# EasyEDA Pro project REVERB.epro

# Schematic REVERB

## Sheets
1 MAIN: Board Name: Board1; Create Date: 2026-10-26; Page Name: P1; Project Name: REVERB; Schematic Name: Schematic1; Update Date: 2026-10-26; Company: Shota Azuma; Drawn: Shota Azuma; Page Size: A4; Reviewed: Shota Azuma; Version: V1.0.1
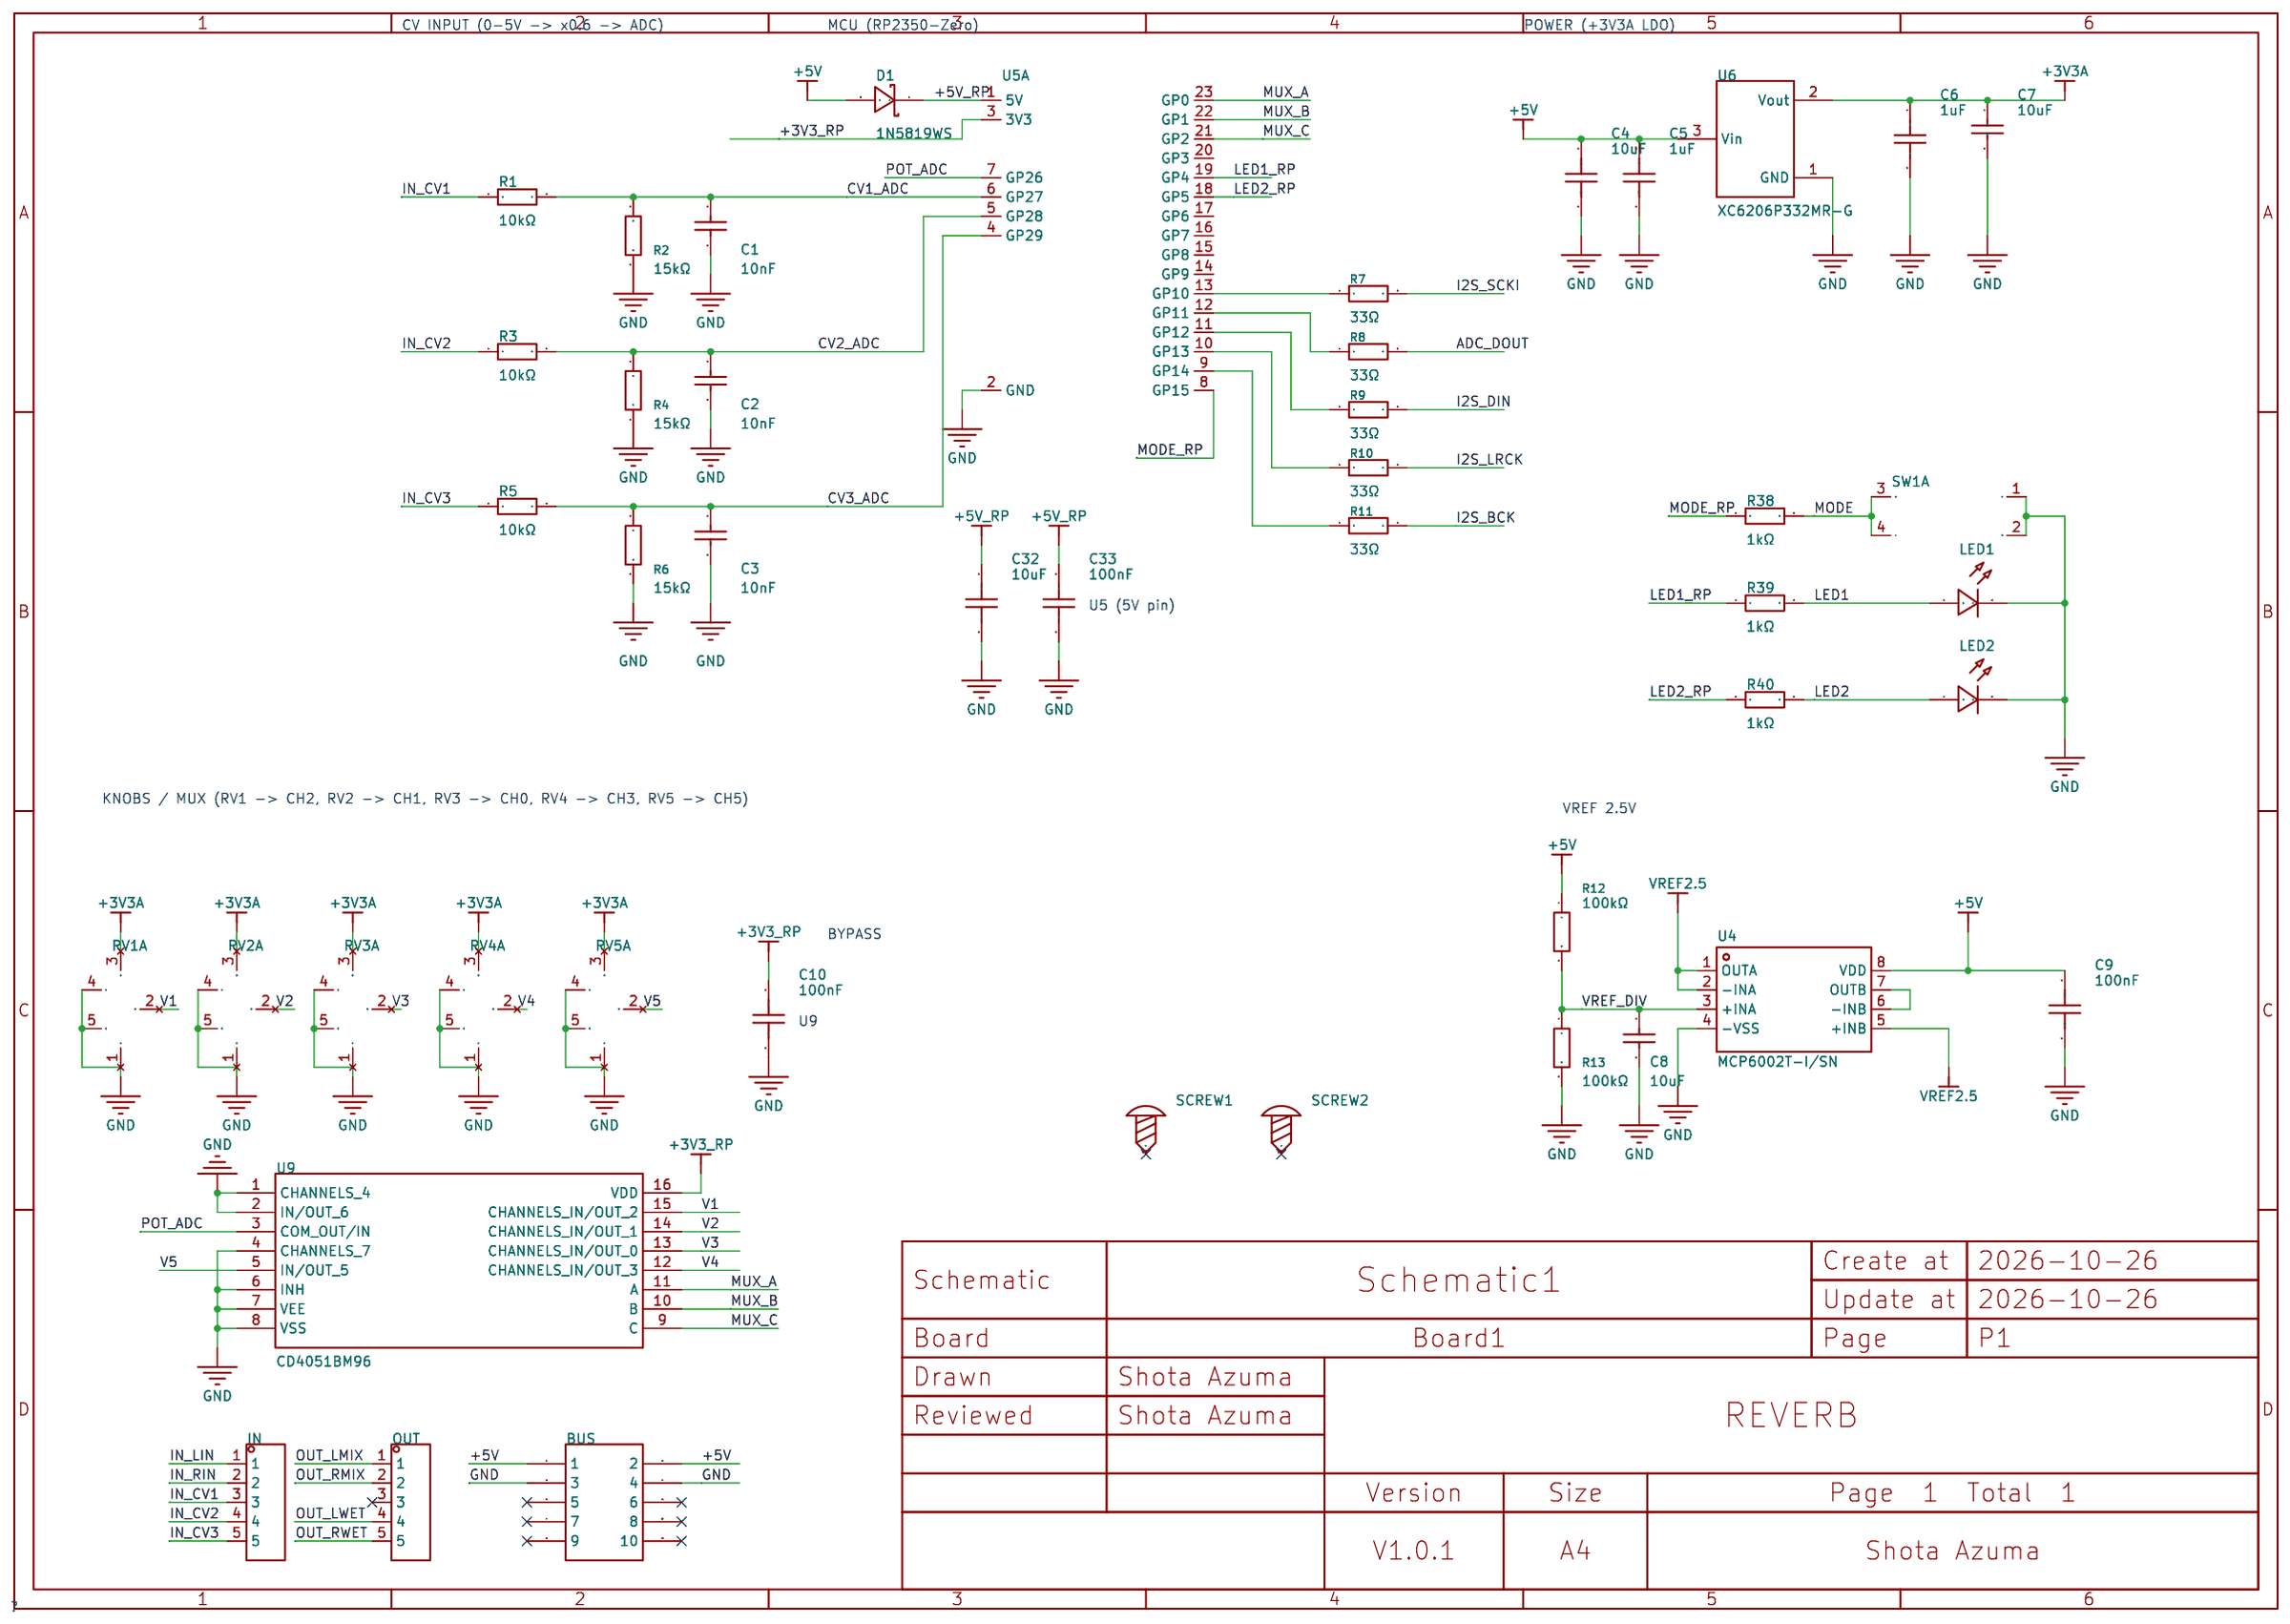
[diagram p0: MAIN]
2 ANALOG_IN_ADC: Page Name: P2
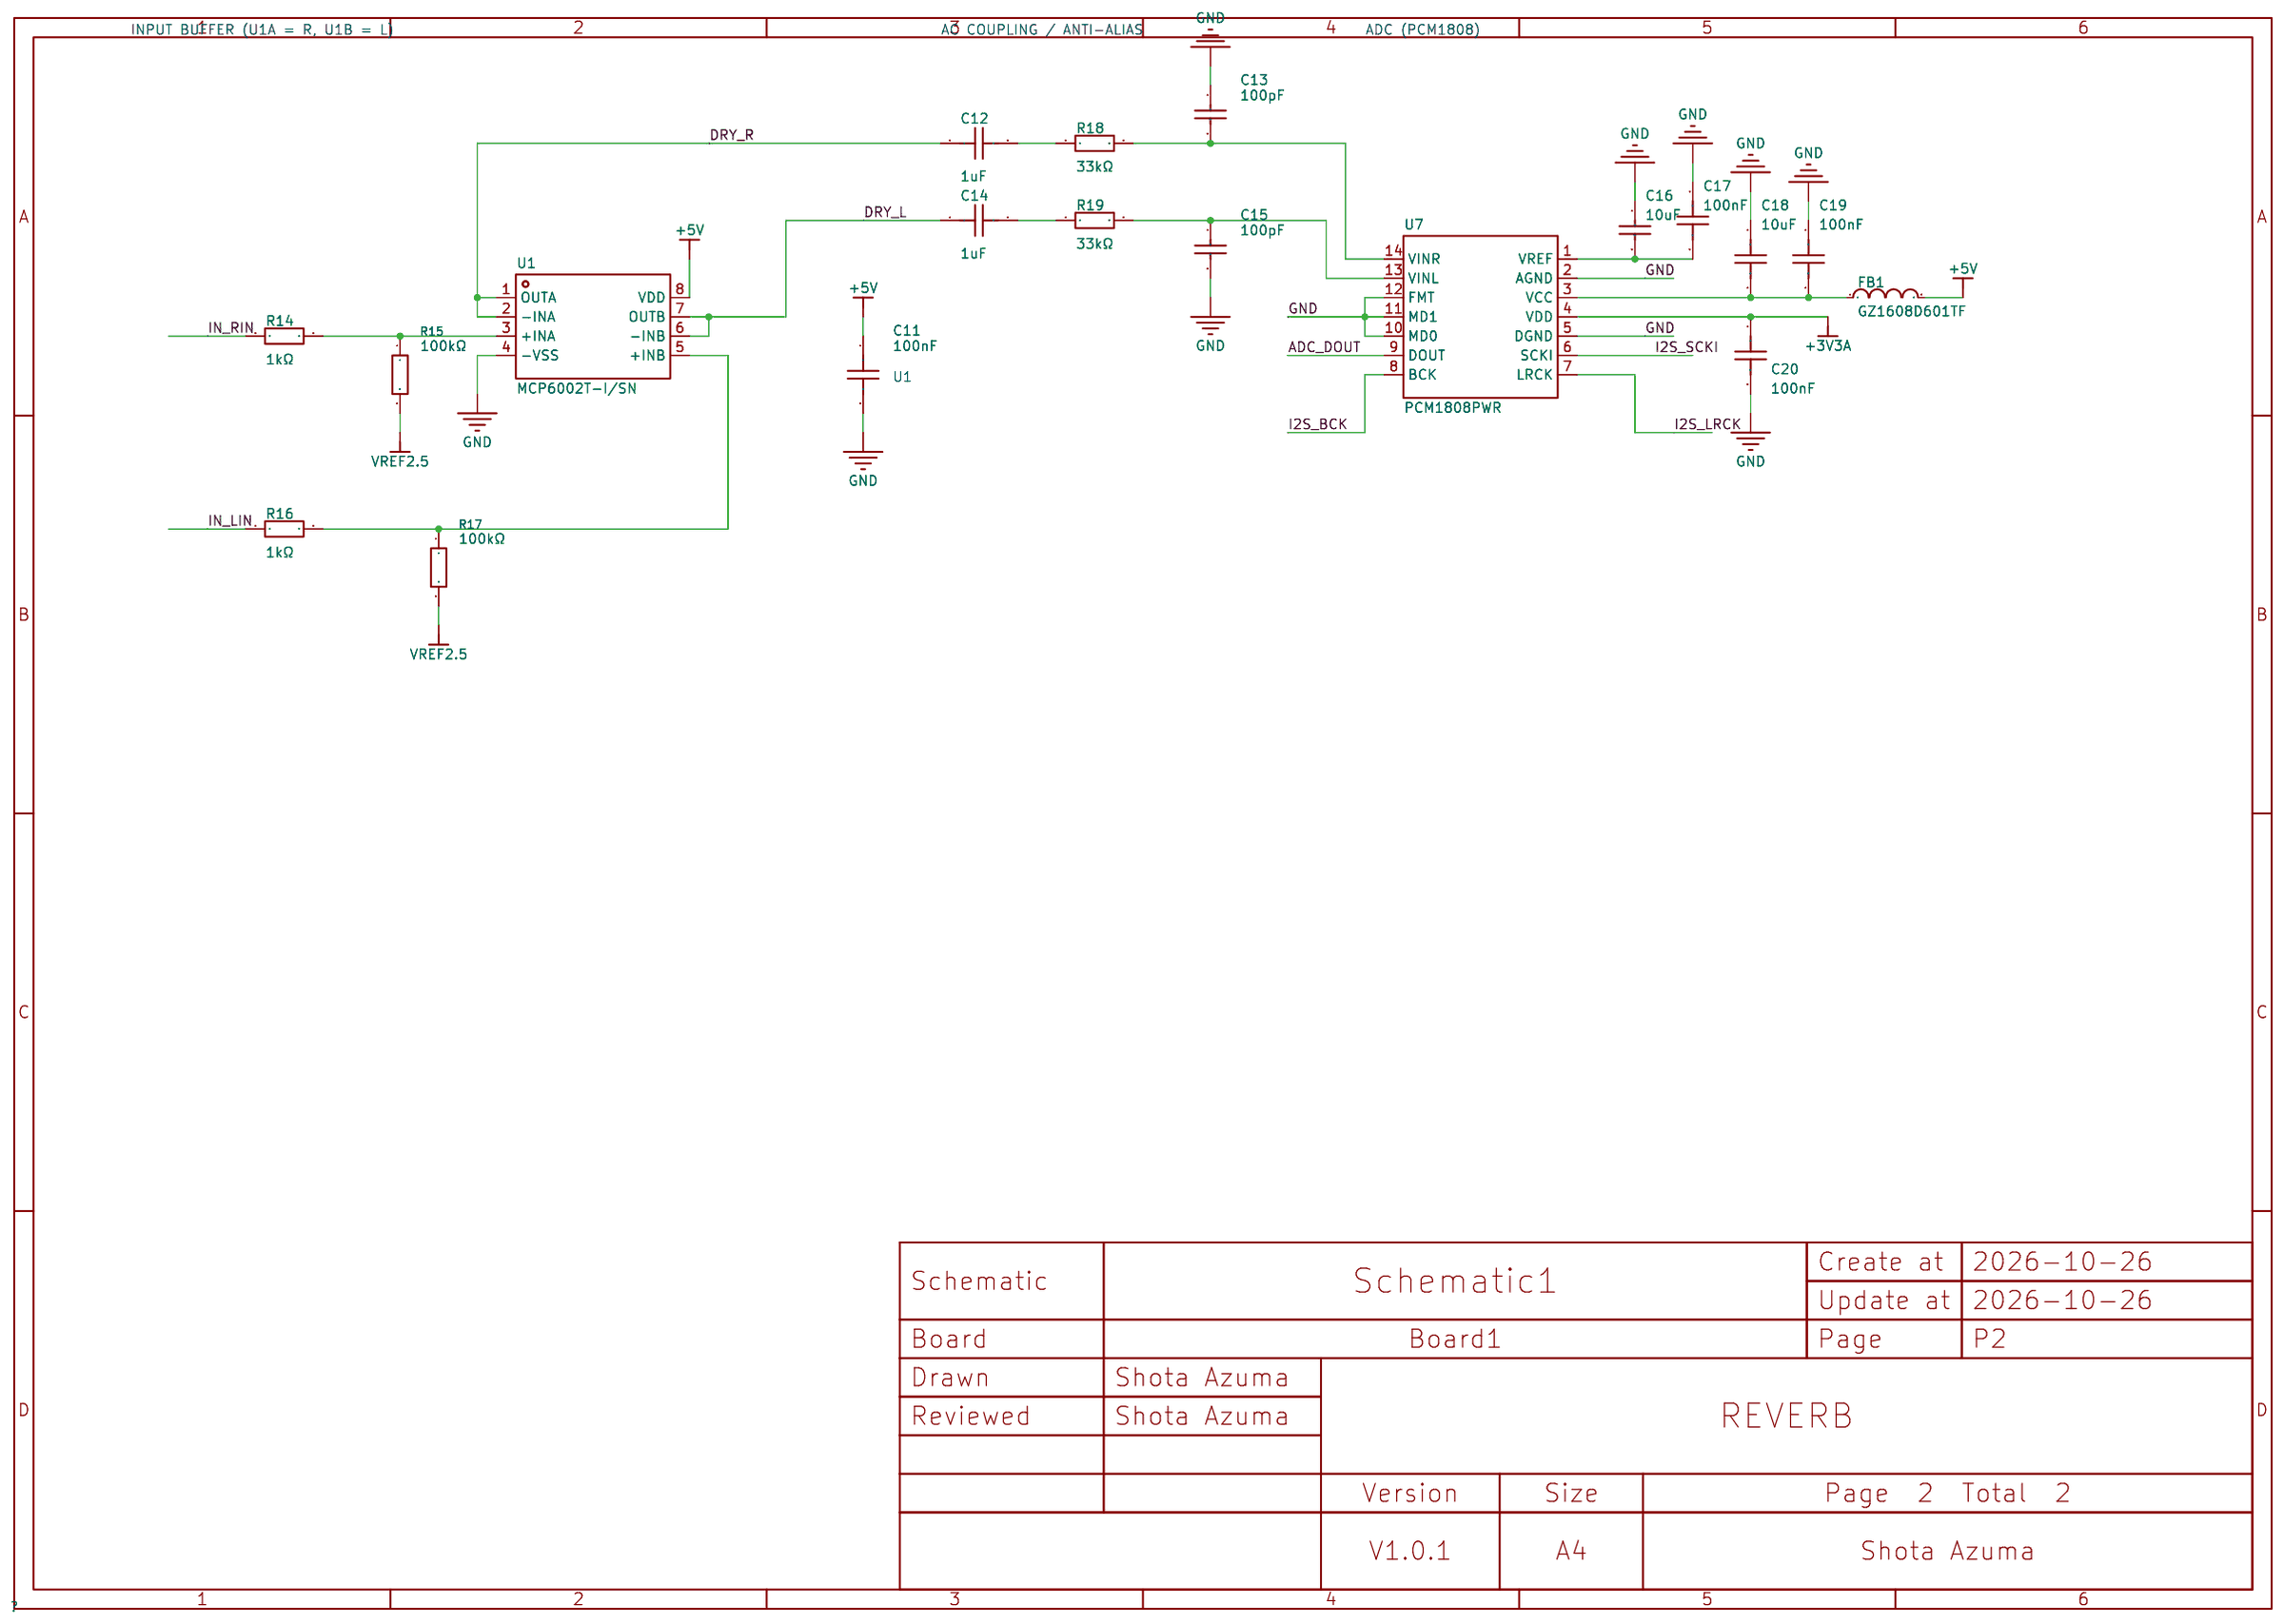
[diagram p1: ANALOG_IN_ADC]
3 DAC_WET_MIX
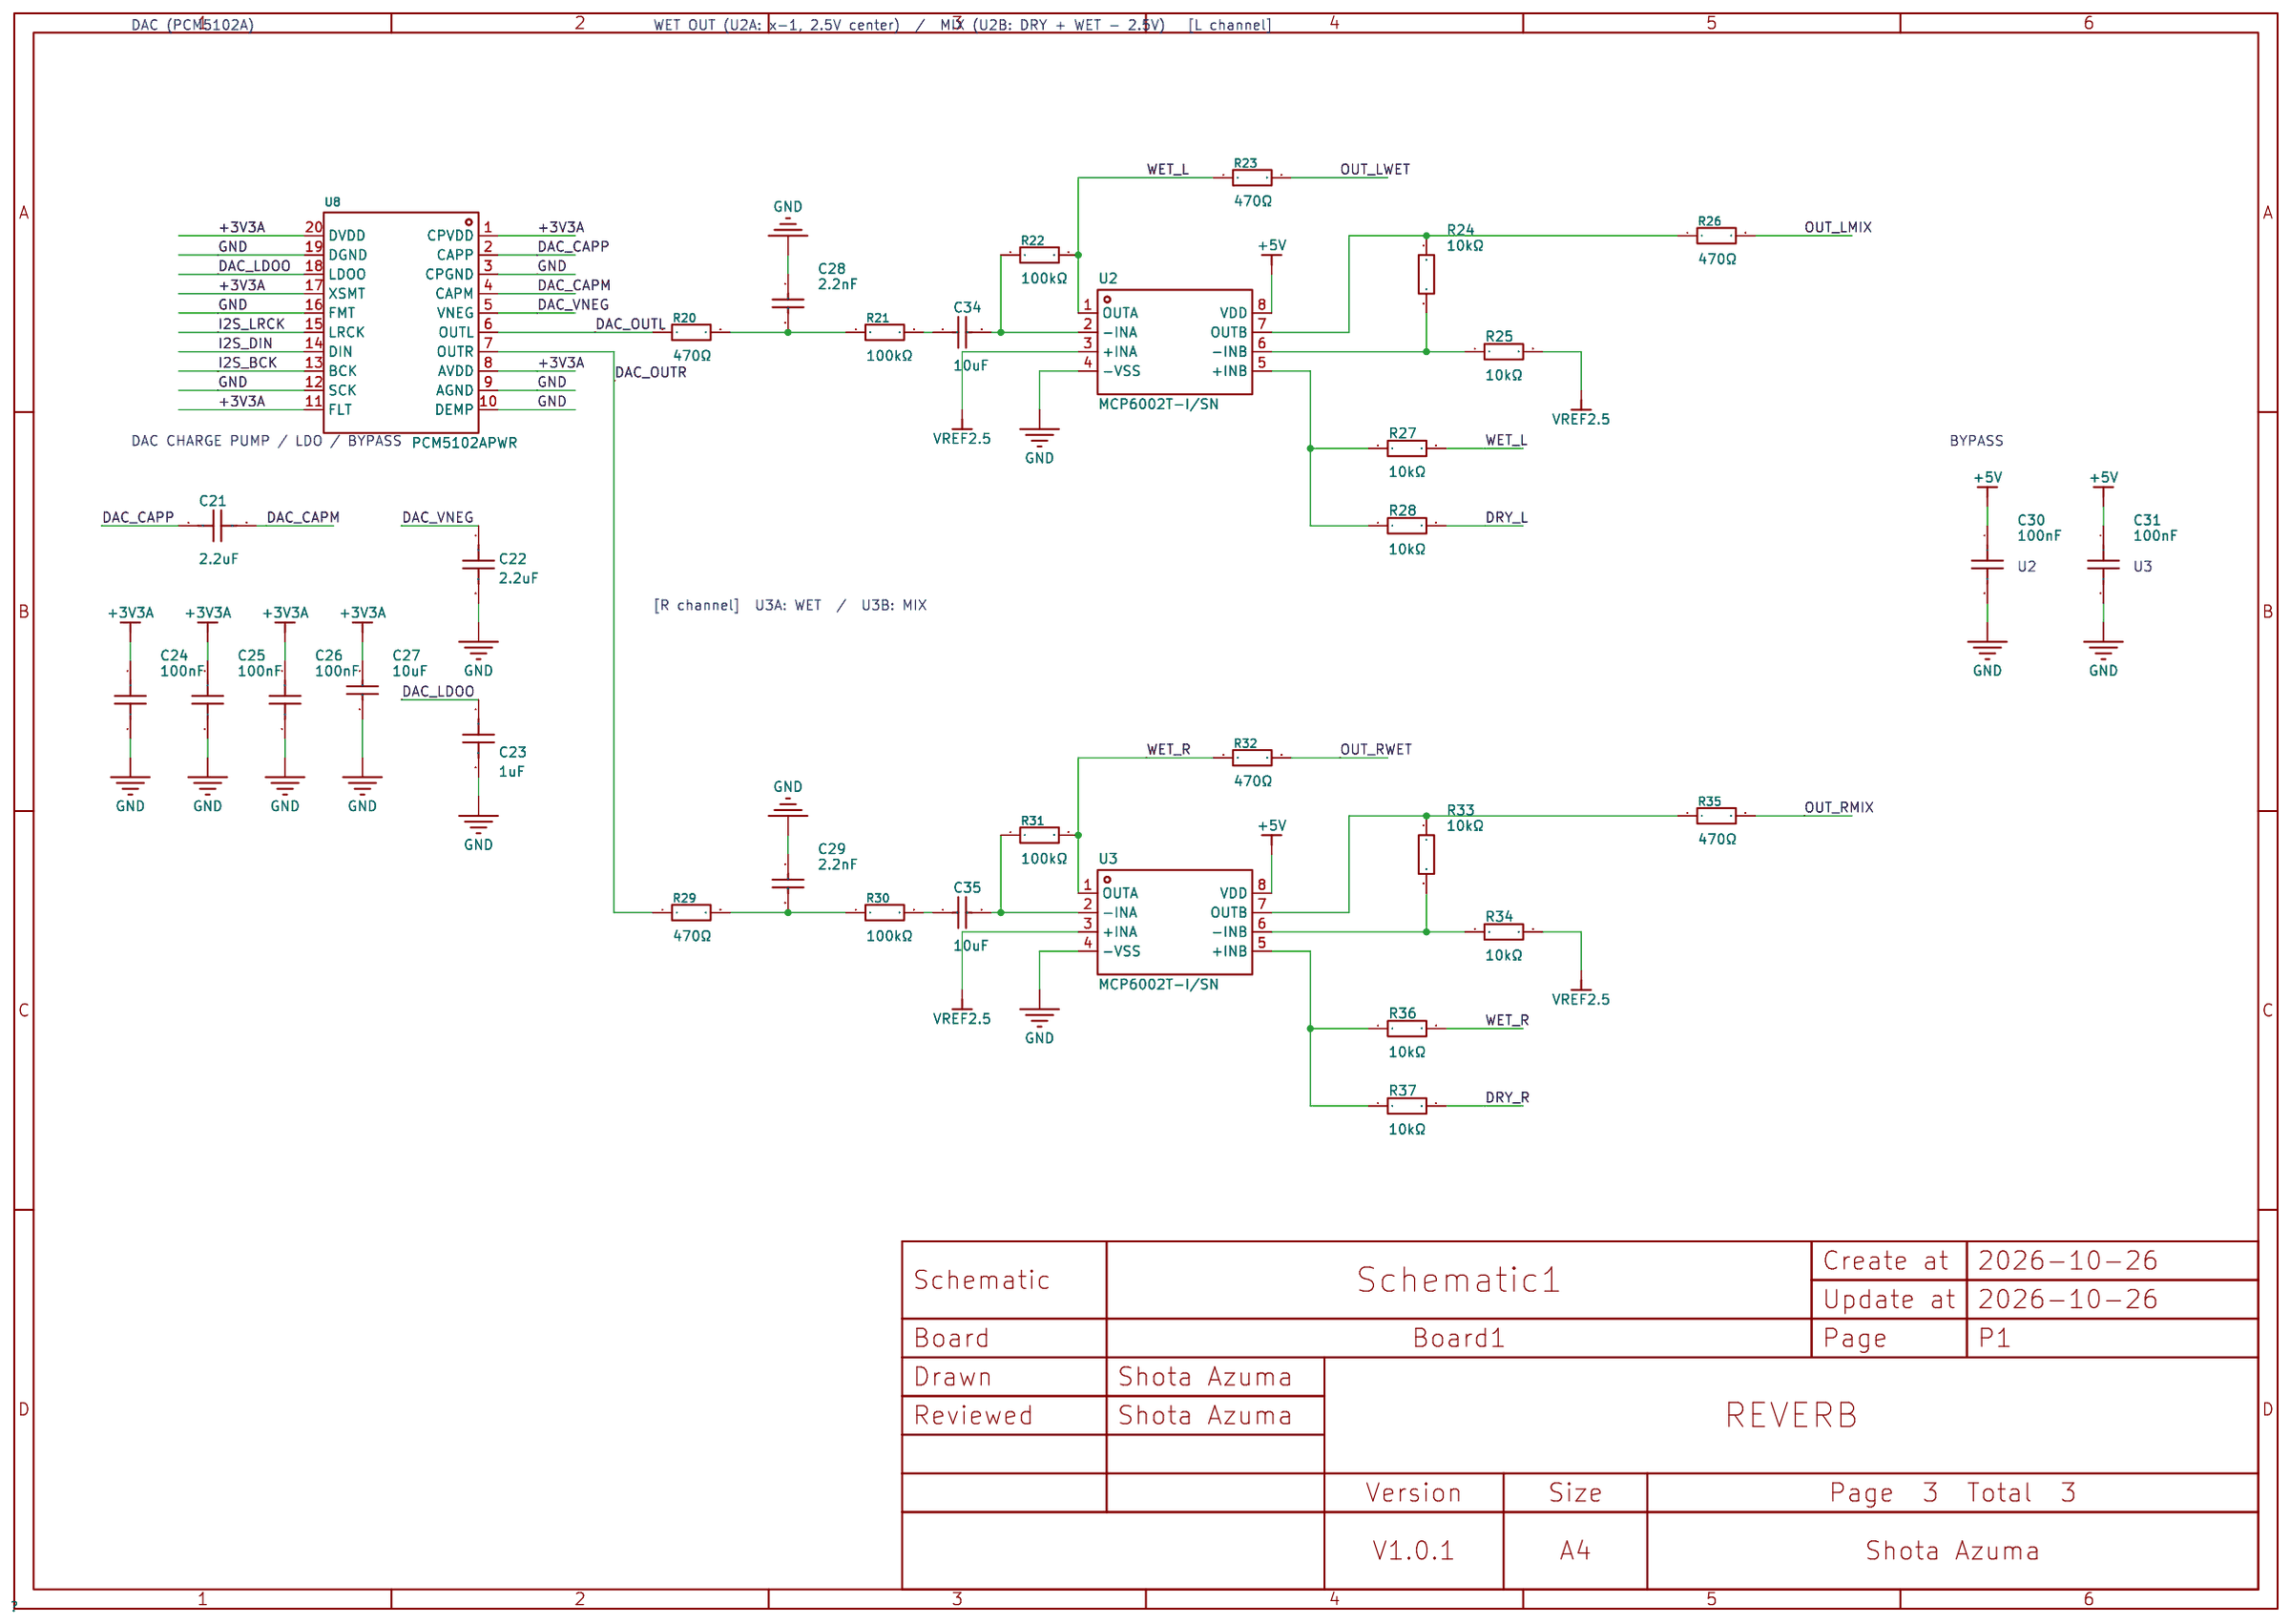
[diagram p2: DAC_WET_MIX]

## Parts
sheet ANALOG_IN_ADC
C11  100nF  [C0402]
C12  1uF  [C0402]
C13  100pF  [C0402]
C14  1uF  [C0402]
C15  100pF  [C0402]
C16  10uF  [C0402]
C17  100nF  [C0402]
C18  10uF  [C0603]
C19  100nF  [C0402]
C20  100nF  [C0402]
FB1  GZ1608D601TF  [L0603]
R14  1kΩ  [R0402]
R15  100kΩ  [R0402]
R16  1kΩ  [R0402]
R17  100kΩ  [R0402]
R18  33kΩ  [R0402]
R19  33kΩ  [R0402]
U1  MCP6002T-I/SN  [SOIC-8_L4.9-W3.9-P1.27-LS6.0-BL]
U7  PCM1808PWR  [TSSOP-14_L5.0-W4.4-P0.65-LS6.4-BL]
sheet DAC_WET_MIX
C21  2.2uF  [C0402]
C22  2.2uF  [C0402]
C23  1uF  [C0402]
C24  100nF  [C0402]
C25  100nF  [C0402]
C26  100nF  [C0402]
C27  10uF  [C0402]
C28  2.2nF  [C0603]
C29  2.2nF  [C0603]
C30  100nF  [C0402]
C31  100nF  [C0402]
C34  10uF  [C0402]
C35  10uF  [C0402]
R20  470Ω  [R0402]
R21  100kΩ  [R0402]
R22  100kΩ  [R0402]
R23  470Ω  [R0402]
R24  10kΩ  [R0402]
R25  10kΩ  [R0402]
R26  470Ω  [R0402]
R27  10kΩ  [R0402]
R28  10kΩ  [R0402]
R29  470Ω  [R0402]
R30  100kΩ  [R0402]
R31  100kΩ  [R0402]
R32  470Ω  [R0402]
R33  10kΩ  [R0402]
R34  10kΩ  [R0402]
R35  470Ω  [R0402]
R36  10kΩ  [R0402]
R37  10kΩ  [R0402]
U2  MCP6002T-I/SN  [SOIC-8_L4.9-W3.9-P1.27-LS6.0-BL]
U3  MCP6002T-I/SN  [SOIC-8_L4.9-W3.9-P1.27-LS6.0-BL]
U8  PCM5102APWR  [TSSOP-20_L6.5-W4.4-P0.65-LS6.4-BL]
sheet MAIN
BUS  -  [HDR-TH_10P-P2.54-V-F-R2-C5-S2.54]  (no BOM)
C1  10nF  [C0402]
C2  10nF  [C0402]
C3  10nF  [C0402]
C4  10uF  [C0603]
C5  1uF  [C0402]
C6  1uF  [C0402]
C7  10uF  [C0402]
C8  10uF  [C0402]
C9  100nF  [C0402]
C10  100nF  [C0402]
C32  10uF  [C0603]
C33  100nF  [C0402]
D1  1N5819WS  [SOD-323_L1.8-W1.3-LS2.5-RD]
IN  -  [HDR-TH_5P-P2.54-V-M]  (no BOM)
LED1  -  [LED-TH_BD3.0-P2.54-FD]  (no BOM)
LED2  -  [LED-TH_BD3.0-P2.54-FD]  (no BOM)
OUT  -  [HDR-TH_5P-P2.54-V-M]  (no BOM)
R1  10kΩ  [R0402]
R2  15kΩ  [R0402]
R3  10kΩ  [R0402]
R4  15kΩ  [R0402]
R5  10kΩ  [R0402]
R6  15kΩ  [R0402]
R7  33Ω  [R0402]
R8  33Ω  [R0402]
R9  33Ω  [R0402]
R10  33Ω  [R0402]
R11  33Ω  [R0402]
R12  100kΩ  [R0402]
R13  100kΩ  [R0402]
R38  1kΩ  [R0402]
R39  1kΩ  [R0402]
R40  1kΩ  [R0402]
RV1  -  [ALPS_RK09K_Vertical]  (section 1)  (no BOM)
RV2  -  [ALPS_RK09K_Vertical]  (section 1)  (no BOM)
RV3  -  [ALPS_RK09K_Vertical]  (section 1)  (no BOM)
RV4  -  [ALPS_RK09K_Vertical]  (section 1)  (no BOM)
RV5  -  [ALPS_RK09K_Vertical]  (section 1)  (no BOM)
SCREW1  -  [Screw-Hole-M3]  (no BOM)
SCREW2  -  [Screw-Hole-M3]  (no BOM)
SW1  -  [TVDP01-G73BB]  (section 1)  (no BOM)
U4  MCP6002T-I/SN  [SOIC-8_L4.9-W3.9-P1.27-LS6.0-BL]
U5  -  [RP2350-Zero]  (section 1)  (no BOM)
U6  XC6206P332MR-G  [SOT-23-3_L2.9-W1.6-P1.90-LS2.8-BR]
U9  CD4051BM96  [SOIC-16_L9.9-W3.9-P1.27-LS6.0-BL]

## Library data of the parts
C9-C11 C17 C19 C20 C24-C26 C30 C31 C33 = CL05B104KO5NNNC: Capacitance:100nF Tolerance:±10% Tolerance:±10% Voltage Rating:16V Temperature Coefficient:X7R; LCSC Part Name: 100nF ±10% 16V; Supplier Part: C1525; Manufacturer: SAMSUNG(三星); Supplier Footprint: 0402; JLCPCB Part Class: Basic Part; Datasheet: https://item.szlcsc.com/datasheet/CL05B104KO5NNNC/1877.html; Supplier: LCSC; Tolerance: ±10%; Voltage Rating: 16V; Temperature Coefficient: X7R
C5 C6 C12 C14 C23 = CL05A105KA5NQNC: Capacitance:1uF Tolerance:±10% Tolerance:±10% Voltage Rating:25V Temperature Coefficient:X5R; LCSC Part Name: 1uF ±10% 25V; Supplier Part: C52923; Manufacturer: SAMSUNG(三星); Supplier Footprint: 0402; JLCPCB Part Class: Basic Part; Datasheet: https://item.szlcsc.com/datasheet/CL05A105KA5NQNC/53938.html; Supplier: LCSC; Tolerance: ±10%; Voltage Rating: 25V; Temperature Coefficient: X5R
C13 C15 = 0402CG101J500NT: Capacitance:100pF Tolerance:±5% Tolerance:±5% Voltage Rating:50V Temperature Coefficient:C0G; LCSC Part Name: 100pF ±5% 50V; Supplier Part: C1546; Manufacturer: FH(风华); Supplier Footprint: 0402; JLCPCB Part Class: Basic Part; Datasheet: https://item.szlcsc.com/datasheet/0402CG101J500NT/1898.html; Supplier: LCSC; Tolerance: ±5%; Voltage Rating: 50V; Temperature Coefficient: C0G
C7 C8 C16 C27 C34 C35 = CL05A106MQ5NUNC: Capacitance:10uF Tolerance:±20% Tolerance:±20% Voltage Rating:6.3V Temperature Coefficient:X5R; LCSC Part Name: 10uF ±20% 6.3V; Supplier Part: C15525; Manufacturer: SAMSUNG(三星); Supplier Footprint: 0402; JLCPCB Part Class: Basic Part; Datasheet: https://item.szlcsc.com/datasheet/CL05A106MQ5NUNC/16204.html; Supplier: LCSC; Tolerance: ±20%; Voltage Rating: 6.3V; Temperature Coefficient: X5R
C4 C18 C32 = CL10A106KP8NNNC: Capacitance:10uF Tolerance:±10% Tolerance:±10% Voltage Rating:10V Temperature Coefficient:X5R; LCSC Part Name: 10uF ±10% 10V; Supplier Part: C19702; Manufacturer: SAMSUNG(三星); Supplier Footprint: 0603; JLCPCB Part Class: Basic Part; Datasheet: https://item.szlcsc.com/datasheet/CL10A106KP8NNNC/20411.html; Supplier: LCSC; Tolerance: ±10%; Voltage Rating: 10V; Temperature Coefficient: X5R
FB1 = GZ1608D601TF: Impedance @ Frequency:600Ω@100MHz Tolerance:±25% Tolerance:±25% DC Resistance(DCR):450mΩ Current Rating:200mA Number of Circuits:1 Operating Temperature:-55℃~+125℃ Operating Temperature:-55℃~+125℃; LCSC Part Name: 单路 0603磁珠 阻抗600Ω@100MHz; Supplier Part: C1002; Manufacturer: Sunlord(顺络); Supplier Footprint: 0603; JLCPCB Part Class: Basic Part; Datasheet: https://item.szlcsc.com/datasheet/GZ1608D601TF/1354.html; Supplier: LCSC; Impedance @ Frequency: 600Ω@100MHz; Tolerance: ±25%; DC Resistance(DCR): 450mΩ; Current Rating: 200mA; Number of Circuits: 1; Operating Temperature: -55℃~+125℃
R14 R16 R38-R40 = 0402WGF1001TCE: Type:Thick Film Resistor Resistance:1kΩ Tolerance:±1% Tolerance:±1% Power(Watts):62.5mW Voltage-Supply(Max):50V Temperature Coefficient:±100ppm/℃ Temperature Coefficient:±100ppm/℃ Operating Temperature:-55℃~+155℃ Operating Temperature:-55℃~+155℃; LCSC Part Name: 厚膜电阻 1kΩ ±1%; Supplier Part: C11702; Manufacturer: UNI-ROYAL(厚声); Supplier Footprint: 0402; JLCPCB Part Class: Basic Part; Datasheet: https://item.szlcsc.com/datasheet/0402WGF1001TCE/12256.html; Supplier: LCSC; Type: Thick Film Resistor; Tolerance: ±1%; Power(Watts): 62.5mW; Voltage-Supply(Max): 50V; Temperature Coefficient: ±100ppm/℃; Operating Temperature: -55℃~+155℃
R12 R13 R15 R17 R21 R22 R30 R31 = 0402WGF1003TCE: Type:Thick Film Resistor Resistance:100kΩ Tolerance:±1% Tolerance:±1% Power(Watts):62.5mW Voltage-Supply(Max):50V Temperature Coefficient:±100ppm/℃ Temperature Coefficient:±100ppm/℃ Operating Temperature:-55℃~+155℃ Operating Temperature:-55℃~+155℃; LCSC Part Name: 厚膜电阻 100kΩ ±1%; Supplier Part: C25741; Manufacturer: UNI-ROYAL(厚声); Supplier Footprint: 0402; JLCPCB Part Class: Basic Part; Datasheet: https://item.szlcsc.com/datasheet/0402WGF1003TCE/26484.html; Supplier: LCSC; Type: Thick Film Resistor; Tolerance: ±1%; Power(Watts): 62.5mW; Voltage-Supply(Max): 50V; Temperature Coefficient: ±100ppm/℃; Operating Temperature: -55℃~+155℃
R18 R19 = 0402WGF3302TCE: Type:Thick Film Resistors Resistance:33kΩ Tolerance:±1% Tolerance:±1% Power(Watts): Overload Voltage (Max): Temperature Coefficient:±100ppm/℃ Temperature Coefficient:±100ppm/℃ Operating Temperature Range:-55℃~+155℃ Operating Temperature Range:-55℃~+155℃; LCSC Part Name: 33kΩ ±1% 62.5mW 厚膜电阻; Supplier Part: C25779; Manufacturer: UNI-ROYAL(厚声); Supplier Footprint: 0402; JLCPCB Part Class: Basic Part; Datasheet: https://atta.szlcsc.com/upload/public/pdf/source/20200306/C422600_1E6D84923E4A46A82E41ADD87F860B5C.pdf; Supplier: LCSC; Type: Thick Film Resistors; Tolerance: ±1%; Temperature Coefficient: ±100ppm/℃; Operating Temperature Range: -55℃~+155℃
U1-U4 = MCP6002T-I/SN: Number of Channels:2 Rail to Rail:Rail-to-Rail Input, Rail-to-Rail Output Gain Bandwidth Product:1MHz Vos - Input Offset Voltage:4.5mV Input Offset Voltage Drift(Vos TC):2uV/℃ Slew Rate:600V/ms Ib - Input Bias Current:1pA Input Offset Current(Ios):1pA Inp; LCSC Part Name: 1 MHz 低功耗运算放大器; Supplier Part: C7377; Manufacturer: MICROCHIP(美国微芯); Supplier Footprint: SOIC-8; JLCPCB Part Class: Extended Part; Datasheet: https://item.szlcsc.com/datasheet/MCP6002T-I%252FSN/7854.html; Supplier: LCSC; Number of Channels: 2; Rail to Rail: Rail-to-Rail Input, Rail-to-Rail Output; Gain Bandwidth Product: 1MHz; Vos - Input Offset Voltage: 4.5mV; Input Offset Voltage Drift(Vos TC): 2uV/℃; Slew Rate: 600V/ms; Ib - Input Bias Current: 1pA; Input Offset Current(Ios): 1pA; Input Voltage Noise Density: 28nV/√Hz@1kHz; Common Mode Rejection Ratio(CMRR): 76dB; Quiescent Current: 100uA; Output Current: 23mA; Operating Temperature: -40℃~+125℃; Single supply: 1.8V~6V
U7 = PCM1808PWR: Resolution (Bits):24 Number of Channels:2 Voltage - Supply:4.5V~5.5V Voltage - Supply:4.5V~5.5V Interface Type:I2S The Chip Type:Audio Analog-to-Digital Converter Operating Temperature:-40℃~+85℃ Operating Temperature:-40℃~+85℃ Sampling Rate:96000Hz Quiesc; LCSC Part Name: 单端模拟输入24位96kHz立体声A/D转换器; Supplier Part: C55513; Manufacturer: TI(德州仪器); Supplier Footprint: TSSOP-14; JLCPCB Part Class: Extended Part; Datasheet: https://www.ti.com/cn/lit/ds/symlink/pcm1808.pdf; Supplier: LCSC; Resolution (Bits): 24; Number of Channels: 2; Voltage - Supply: 4.5V~5.5V; Interface Type: I2S; The Chip Type: Audio Analog-to-Digital Converter; Operating Temperature: -40℃~+85℃; Sampling Rate: 96000Hz; Quiescent Current (Iq): 150uA；1uA; Features: Power-down mode；Digital filtering; Architecture: Sigma-Delta
C21 C22 = CL05A225MQ5NSNC: Capacitance:2.2uF Tolerance:±20% Tolerance:±20% Voltage Rating:6.3V Temperature Coefficient:X5R; LCSC Part Name: 2.2uF ±20% 6.3V; Supplier Part: C12530; Manufacturer: SAMSUNG(三星); Supplier Footprint: 0402; JLCPCB Part Class: Basic Part; Datasheet: https://item.szlcsc.com/datasheet/CL05A225MQ5NSNC/13164.html; Supplier: LCSC; Tolerance: ±20%; Voltage Rating: 6.3V; Temperature Coefficient: X5R
C28 C29 = 0603B222K500NT: Capacitance:2.2nF Tolerance:±10% Tolerance:±10% Voltage Rating:50V Temperature Coefficient:X7R; LCSC Part Name: 2.2nF ±10% 50V; Supplier Part: C1604; Manufacturer: FH(风华); Supplier Footprint: 0603; JLCPCB Part Class: Basic Part; Datasheet: https://item.szlcsc.com/datasheet/0603B222K500NT/1956.html; Supplier: LCSC; Tolerance: ±10%; Voltage Rating: 50V; Temperature Coefficient: X7R
R20 R23 R26 R29 R32 R35 = 0402WGF4700TCE: Type:Thick Film Resistor Resistance:470Ω Tolerance:±1% Tolerance:±1% Power(Watts):62.5mW Voltage-Supply(Max):50V Temperature Coefficient:±100ppm/℃ Temperature Coefficient:±100ppm/℃ Operating Temperature:-55℃~+155℃ Operating Temperature:-55℃~+155℃; LCSC Part Name: 厚膜电阻 470Ω ±1%; Supplier Part: C25117; Manufacturer: UNI-ROYAL(厚声); Supplier Footprint: 0402; JLCPCB Part Class: Basic Part; Datasheet: https://item.szlcsc.com/datasheet/0402WGF4700TCE/25860.html; Supplier: LCSC; Type: Thick Film Resistor; Tolerance: ±1%; Power(Watts): 62.5mW; Voltage-Supply(Max): 50V; Temperature Coefficient: ±100ppm/℃; Operating Temperature: -55℃~+155℃
R1 R3 R5 R24 R25 R27 R28 R33 R34 R36 R37 = 0402WGF1002TCE: Type:Thick Film Resistor Resistance:10kΩ Tolerance:±1% Tolerance:±1% Power(Watts):62.5mW Voltage-Supply(Max):50V Temperature Coefficient:±100ppm/℃ Temperature Coefficient:±100ppm/℃ Operating Temperature:-55℃~+155℃ Operating Temperature:-55℃~+155℃; LCSC Part Name: 厚膜电阻 10kΩ ±1%; Supplier Part: C25744; Manufacturer: UNI-ROYAL(厚声); Supplier Footprint: 0402; JLCPCB Part Class: Basic Part; Datasheet: https://item.szlcsc.com/datasheet/0402WGF1002TCE/26487.html; Supplier: LCSC; Type: Thick Film Resistor; Tolerance: ±1%; Power(Watts): 62.5mW; Voltage-Supply(Max): 50V; Temperature Coefficient: ±100ppm/℃; Operating Temperature: -55℃~+155℃
U8 = PCM5102APWR: Resolution (Bits):32 Number of Channels:2 Voltage - Supply:1.8V~3.3V Voltage - Supply:1.8V~3.3V Interface Type:I2S The Chip Type:Audio Decoder Operating Temperature:-25℃~+85℃ Operating Temperature:-25℃~+85℃ Sampling Rate:384kHz Quiescent Current (Iq):500u; LCSC Part Name: 具有PLL和32位、384kHz PCM接口的2.1VRMS音频立体声DAC; Supplier Part: C107671; Manufacturer: TI(德州仪器); Supplier Footprint: TSSOP-20; JLCPCB Part Class: Extended Part; Datasheet: https://www.ti.com/cn/lit/ds/symlink/pcm5102a.pdf; Supplier: LCSC; Resolution (Bits): 32; Number of Channels: 2; Voltage - Supply: 1.8V~3.3V; Interface Type: I2S; The Chip Type: Audio Decoder; Operating Temperature: -25℃~+85℃; Sampling Rate: 384kHz; Quiescent Current (Iq): 500uA; Features: Power-down mode；Digital filtering
BUS = HDR-F_2.54_2x5: Supplier Footprint: Through
C1-C3 = CL05B103KB5NNNC: Capacitance:10nF Tolerance:±10% Tolerance:±10% Voltage Rating:50V Temperature Coefficient:X7R; LCSC Part Name: 10nF ±10% 50V; Supplier Part: C15195; Manufacturer: SAMSUNG(三星); Supplier Footprint: 0402; JLCPCB Part Class: Basic Part; Datasheet: https://item.szlcsc.com/datasheet/CL05B103KB5NNNC/15869.html; Supplier: LCSC; Tolerance: ±10%; Voltage Rating: 50V; Temperature Coefficient: X7R
D1 = 1N5819WS_C191023: Voltage - Forward(Vf@If):600mV@1A Voltage - DC Reverse(Vr):40V Current - Rectified:1A Non-Repetitive Peak Forward Surge Current:25A; LCSC Part Name: 电压:40V 电流:1A; Supplier Part: C191023; Manufacturer: Hottech(合科泰); Supplier Footprint: SOD-323; JLCPCB Part Class: Basic Part; Datasheet: https://item.szlcsc.com/datasheet/1N5819WS/213850.html; Supplier: LCSC; Voltage - Forward(Vf@If): 600mV@1A; Voltage - DC Reverse(Vr): 40V; Current - Rectified: 1A; Non-Repetitive Peak Forward Surge Current: 25A
IN OUT = HDR-M_2.54_1x5P: Supplier Footprint: Through
LED1 LED2 = LED_TH-R_3mm: Supplier Footprint: Through
R2 R4 R6 = 0402WGF1502TCE: Type:Thick Film Resistors Resistance:15kΩ Tolerance:±1% Tolerance:±1% Power(Watts): Overload Voltage (Max): Temperature Coefficient:±100ppm/℃ Temperature Coefficient:±100ppm/℃ Operating Temperature Range:-55℃~+155℃ Operating Temperature Range:-55℃~+155℃; LCSC Part Name: 15kΩ ±1% 62.5mW 厚膜电阻; Supplier Part: C25756; Manufacturer: UNI-ROYAL(厚声); Supplier Footprint: 0402; JLCPCB Part Class: Basic Part; Datasheet: https://atta.szlcsc.com/upload/public/pdf/source/20200306/C422600_1E6D84923E4A46A82E41ADD87F860B5C.pdf; Supplier: LCSC; Type: Thick Film Resistors; Tolerance: ±1%; Temperature Coefficient: ±100ppm/℃; Operating Temperature Range: -55℃~+155℃
R7-R11 = 0402WGF330JTCE: Type:Thick Film Resistor Resistance:33Ω Tolerance:±1% Tolerance:±1% Power(Watts):62.5mW Voltage-Supply(Max):50V Temperature Coefficient:±100ppm/℃ Temperature Coefficient:±100ppm/℃ Operating Temperature:-55℃~+155℃ Operating Temperature:-55℃~+155℃; LCSC Part Name: 33Ω ±1% 62.5mW 厚膜电阻; Supplier Part: C25105; Manufacturer: UNI-ROYAL(厚声); Supplier Footprint: 0402; JLCPCB Part Class: Basic Part; Datasheet: https://item.szlcsc.com/datasheet/0402WGF330JTCE/25848.html; Supplier: LCSC; Type: Thick Film Resistor; Tolerance: ±1%; Power(Watts): 62.5mW; Voltage-Supply(Max): 50V; Temperature Coefficient: ±100ppm/℃; Operating Temperature: -55℃~+155℃
RV1-RV5 = ALPS_RK09K_Vertical: ALPS ALPINE RK09K series 9mm rotary potentiometer, vertical PCB mount; Manufacturer: ALPS ALPINE
SCREW1 SCREW2 = Screw-Hole-M3: Supplier Footprint: 插件
SW1 = TVDP01-G73BB: JIANFU TVDP01-G73BB 6x6mm THT tactile switch, H=7.3mm, 180gf, DC12V 50mA. Akizuki; Manufacturer: JIANFU
U5 = RP2350-Zero: Waveshare RP2350-Zero (RP2350A, 23 castellated pins)
U6 = XC6206P332MR-G_C5446: Output Configuration:Positive Voltage - Supply:6V Output Voltage:3.3V Output Voltage:3.3V Output Current:200mA Power Supply Rejection Ratio (PSRR):- Voltage Dropout:- standby current:1uA Noise:- Features:Short Circuit Protection；Over Current Protection Op; LCSC Part Name: 3.3V 200mA 6V; Supplier Part: C5446; Manufacturer: TOREX(特瑞仕); Supplier Footprint: SOT-23-3L; JLCPCB Part Class: Basic Part; Datasheet: https://item.szlcsc.com/datasheet/XC6206P332MR-G/5896.html; Supplier: LCSC; Output Configuration: Positive; Voltage - Supply: 6V; Output Voltage: 3.3V; Output Current: 200mA; standby current: 1uA; Features: Short Circuit Protection；Over Current Protection; Operating Temperature: -40℃~+85℃@(Ta); Output Type: Fixed; Number of Outputs: 1
U9 = CD4051BM96: Switch Circuit:8:1 Number of Channels:1 Ron:125Ω Voltage - Supply:3V~20V Voltage - Supply:3V~20V Con:30pF Turn-on time:- Turn-off time:- Bandwidth:20MHz Operating Temperature:-55℃~+125℃ Operating Temperature:-55℃~+125℃ Propagation Delay (tpd):60ns Feature; LCSC Part Name: 模拟多路复用器/解复用器; Supplier Part: C21379; Manufacturer: TI(德州仪器); Supplier Footprint: SOIC-16-150mil; JLCPCB Part Class: Extended Part; Datasheet: https://www.ti.com/cn/lit/ds/symlink/cd4051b.pdf; Supplier: LCSC; Switch Circuit: 8:1; Number of Channels: 1; Ron: 125Ω; Voltage - Supply: 3V~20V; Con: 30pF; Bandwidth: 20MHz; Operating Temperature: -55℃~+125℃; Propagation Delay (tpd): 60ns; Features: Level shifting；Bidirectional analog channel；Glitch-free switching

## Nets
+3V3_RP: C10.1 U5.3(3V3) U9.16(VDD)
+3V3A: C6.1 C7.1 C20.1 C24.1 C25.1 C26.1 C27.1 RV1.3 RV2.3 RV3.3 RV4.3 RV5.3 U6.2(Vout) U7.4(VDD) U8.1(CPVDD) U8.8(AVDD) U8.11(FLT) U8.17(XSMT) U8.20(DVDD)
+5V: BUS.1 BUS.2 C4.1 C5.1 C9.1 C11.1 C30.1 C31.1 D1.2(A) FB1.2 R12.1 U1.8(VDD) U2.8(VDD) U3.8(VDD) U4.8(VDD) U6.3(Vin)
+5V_RP: C32.1 C33.1 D1.1(K) U5.1(5V)
GND: BUS.3 BUS.4 C1.2 C2.2 C3.2 C4.2 C5.2 C6.2 C7.2 C8.2 C9.2 C10.2 C11.2 C13.1 C15.2 C16.1 C17.1 C18.1 C19.1 C20.2 C22.2 C23.2 C24.2 C25.2 C26.2 C27.2 C28.1 C29.1 C30.2 C31.2 C32.2 C33.2 LED1.2(A) LED2.2(A) R2.2 R4.2 R6.2 R13.2 RV1.1 RV1.4 RV1.5 RV2.1 RV2.4 RV2.5 RV3.1 RV3.4 RV3.5 RV4.1 RV4.4 RV4.5 RV5.1 RV5.4 RV5.5 SW1.1 SW1.2 U1.4(-VSS) U2.4(-VSS) U3.4(-VSS) U4.4(-VSS) U5.2(GND) U6.1(GND) U7.2(AGND) U7.5(DGND) U7.10(MD0) U7.11(MD1) U7.12(FMT) U8.3(CPGND) U8.9(AGND) U8.10(DEMP) U8.12(SCK) U8.16(FMT) U8.19(DGND) U9.1(CHANNELS 4) U9.2(IN/OUT 6) U9.4(CHANNELS 7) U9.6(INH) U9.7(VEE) U9.8(VSS)
V1: RV1.2 U9.15(CHANNELS IN/OUT 2)
V2: RV2.2 U9.14(CHANNELS IN/OUT 1)
V3: RV3.2 U9.13(CHANNELS IN/OUT 0)
V4: RV4.2 U9.12(CHANNELS IN/OUT 3)
V5: RV5.2 U9.5(IN/OUT 5)
ADC_DOUT: R8.2 U7.9(DOUT)
CV1_ADC: C1.1 R1.2 R2.1 U5.6(GP27)
CV2_ADC: C2.1 R3.2 R4.1 U5.5(GP28)
CV3_ADC: C3.1 R5.2 R6.1 U5.4(GP29)
DAC_CAPM: C21.2 U8.4(CAPM)
DAC_CAPP: C21.1 U8.2(CAPP)
DAC_LDOO: C23.1 U8.18(LDOO)
DAC_OUTL: R20.1 U8.6(OUTL)
DAC_OUTR: R29.1 U8.7(OUTR)
DAC_VNEG: C22.1 U8.5(VNEG)
DRY_L: C14.1 R28.2 U1.6(-INB) U1.7(OUTB)
DRY_R: C12.1 R37.2 U1.1(OUTA) U1.2(-INA)
I2S_BCK: R11.2 U7.8(BCK) U8.13(BCK)
I2S_DIN: R9.2 U8.14(DIN)
I2S_LRCK: R10.2 U7.7(LRCK) U8.15(LRCK)
I2S_SCKI: R7.2 U7.6(SCKI)
IN_CV1: IN.3 R1.1
IN_CV2: IN.4 R3.1
IN_CV3: IN.5 R5.1
IN_LIN: IN.1 R16.1
IN_RIN: IN.2 R14.1
LED1: LED1.1(C) R39.2
LED1_RP: R39.1 U5.19(GP4)
LED2: LED2.1(C) R40.2
LED2_RP: R40.1 U5.18(GP5)
MODE: R38.2 SW1.3 SW1.4
MODE_RP: R38.1 U5.8(GP15)
MUX_A: U5.23(GP0) U9.11(A)
MUX_B: U5.22(GP1) U9.10(B)
MUX_C: U5.21(GP2) U9.9(C)
OUT_LMIX: OUT.1 R26.2
OUT_LWET: OUT.4 R23.2
OUT_RMIX: OUT.2 R35.2
OUT_RWET: OUT.5 R32.2
POT_ADC: U5.7(GP26) U9.3(COM OUT/IN)
VREF2.5: R15.2 R17.2 R25.2 R34.2 U2.3(+INA) U3.3(+INA) U4.1(OUTA) U4.2(-INA) U4.5(+INB)
VREF_DIV: C8.1 R12.2 R13.1 U4.3(+INA)
WET_L: R22.2 R23.1 R27.2 U2.1(OUTA)
WET_R: R31.2 R32.1 R36.2 U3.1(OUTA)
Net-(C12-2): C12.2 R18.1
Net-(C13-2): C13.2 R18.2 U7.14(VINR)
Net-(C14-2): C14.2 R19.1
Net-(C15-1): C15.1 R19.2 U7.13(VINL)
Net-(C16-2): C16.2 C17.2 U7.1(VREF)
Net-(C18-2): C18.2 C19.2 FB1.1 U7.3(VCC)
Net-(C28-2): C28.2 R20.2 R21.1
Net-(C29-2): C29.2 R29.2 R30.1
Net-(C34-1): C34.1 R21.2
Net-(C34-2): C34.2 R22.1 U2.2(-INA)
Net-(C35-1): C35.1 R30.2
Net-(C35-2): C35.2 R31.1 U3.2(-INA)
Net-(R7-1): R7.1 U5.13(GP10)
Net-(R8-1): R8.1 U5.12(GP11)
Net-(R9-1): R9.1 U5.11(GP12)
Net-(R10-1): R10.1 U5.10(GP13)
Net-(R11-1): R11.1 U5.9(GP14)
Net-(R14-2): R14.2 R15.1 U1.3(+INA)
Net-(R16-2): R16.2 R17.1 U1.5(+INB)
Net-(R24-1): R24.1 R26.1 U2.7(OUTB)
Net-(R24-2): R24.2 R25.1 U2.6(-INB)
Net-(R27-1): R27.1 R28.1 U2.5(+INB)
Net-(R33-1): R33.1 R35.1 U3.7(OUTB)
Net-(R33-2): R33.2 R34.1 U3.6(-INB)
Net-(R36-1): R36.1 R37.1 U3.5(+INB)
Net-(U4-6): U4.6(-INB) U4.7(OUTB)

Not connected (* = marked no-connect by the designer): BUS 5* 6* 7* 8* 9* 10*; OUT 3*; SCREW1 1*; SCREW2 1*; U5 14(GP9) 15(GP8) 16(GP7) 17(GP6) 20(GP3)

## Notes on the sheets
sheet 1
- CV INPUT (0-5V -> x0.6 -> ADC)
- MCU (RP2350-Zero)
- POWER (+3V3A LDO)
- U5 (5V pin)
- KNOBS / MUX (RV1 -> CH2, RV2 -> CH1, RV3 -> CH0, RV4 -> CH3, RV5 -> CH5)
- VREF 2.5V
- BYPASS
- U9
sheet 2
- INPUT BUFFER (U1A = R, U1B = L)
- AC COUPLING / ANTI-ALIAS
- ADC (PCM1808)
- U1
sheet 3
- DAC (PCM5102A)
- WET OUT (U2A: x-1, 2.5V center)  /  MIX (U2B: DRY + WET - 2.5V)   [L channel]
- DAC CHARGE PUMP / LDO / BYPASS
- BYPASS
- U2
- U3
- [R channel]  U3A: WET  /  U3B: MIX
